# Altium schematic sheet Top_Level.SchDoc: Top Level
size A4; DocumentNumber: 1; SheetNumber: 1; SheetTotal: 18
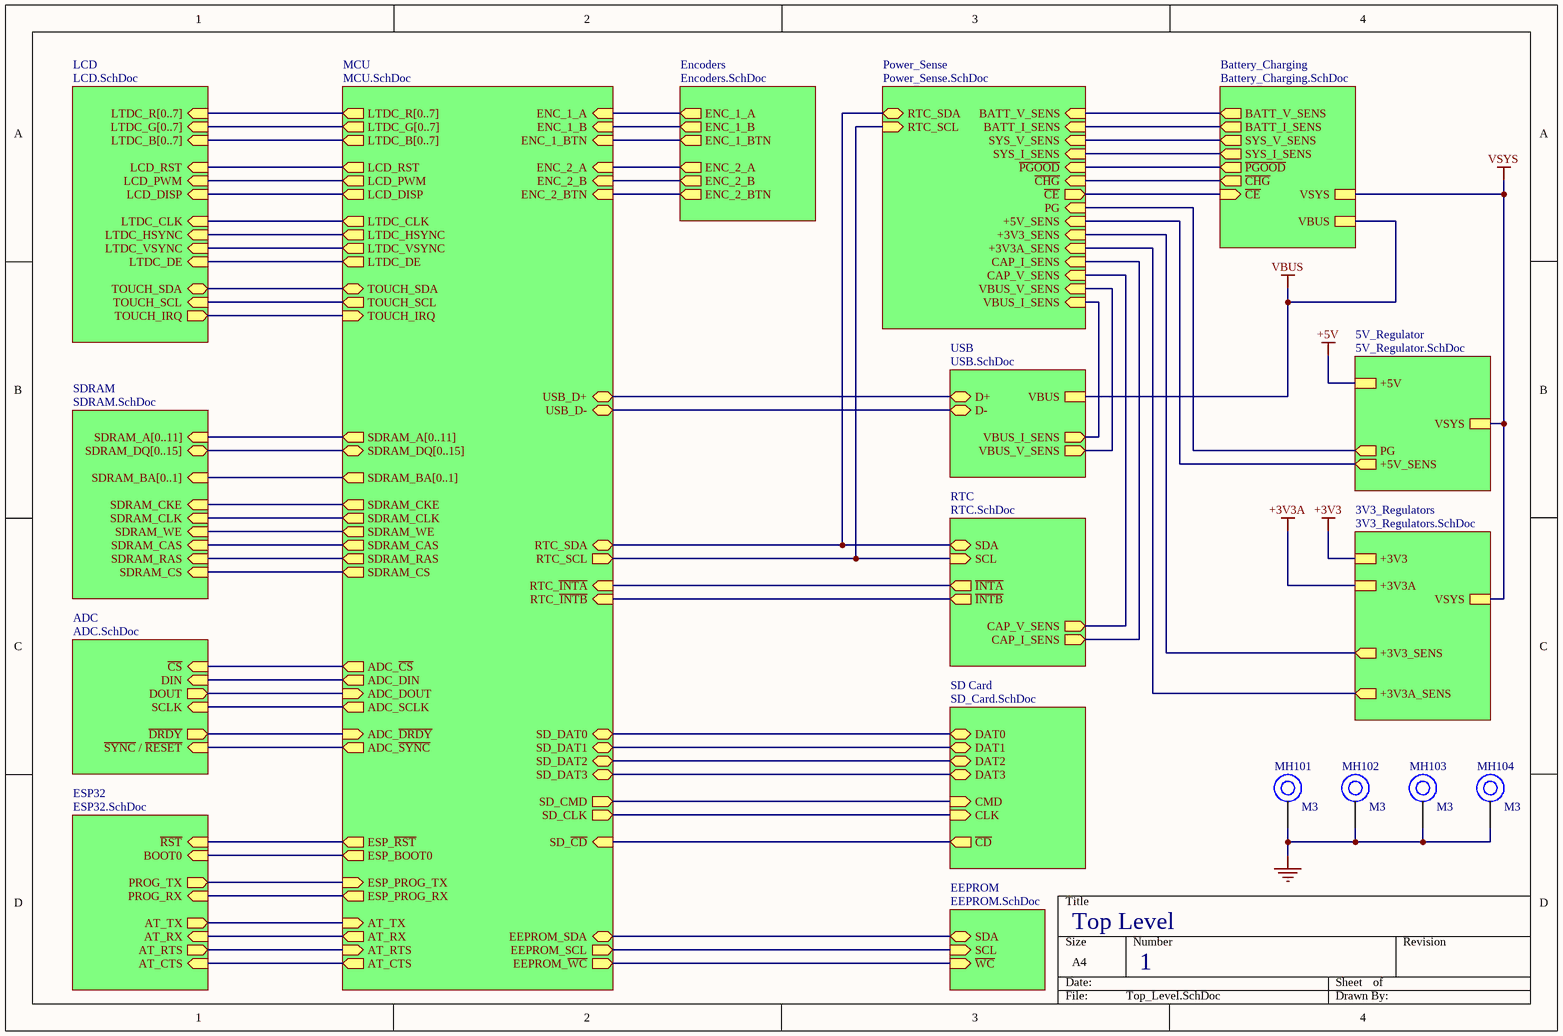
[diagram p0: Top_Level.SchDoc]

## Parts
MH101  M3  [M3_Mounting_Hole]
MH102  M3  [M3_Mounting_Hole]
MH103  M3  [M3_Mounting_Hole]
MH104  M3  [M3_Mounting_Hole]

## Sub-sheets
3V3_Regulators = 3V3_Regulators.SchDoc: +3V3, VSYS, +3V3_SENS (out), +3V3A, +3V3A_SENS (out)
5V_Regulator = 5V_Regulator.SchDoc: +5V, VSYS, PG (out), +5V_SENS (out)
ADC = ADC.SchDoc: ~{CS} (in), DIN (in), DOUT (out), SCLK (in), ~{DRDY} (out), ~{SYNC} / ~{RESET} (in)
Battery_Charging = Battery_Charging.SchDoc: VBUS, BATT_V_SENS (out), BATT_I_SENS (out), SYS_V_SENS (out), SYS_I_SENS (out), ~{PGOOD} (out), ~{CHG} (out), ~{CE} (in), VSYS
EEPROM = EEPROM.SchDoc: SDA (bidir), SCL (in), ~{WC} (in)
Encoders = Encoders.SchDoc: ENC_1_A (out), ENC_1_B (out), ENC_1_BTN (out), ENC_2_BTN (out), ENC_2_B (out), ENC_2_A (out)
ESP32 = ESP32.SchDoc: ~{RST} (in), BOOT0 (in), PROG_RX (in), PROG_TX (out), AT_TX (out), AT_RX (in), AT_RTS (out), AT_CTS (in)
LCD = LCD.SchDoc: LTDC_B[0..7] (in), LTDC_G[0..7] (in), LTDC_R[0..7] (in), LCD_RST (in), LCD_PWM (in), TOUCH_SDA (bidir), TOUCH_SCL (in), TOUCH_IRQ (out), LTDC_DE (in), LTDC_VSYNC (in), LTDC_HSYNC (in), LTDC_CLK (in), LCD_DISP (in)
MCU = MCU.SchDoc: LTDC_B[0..7] (out), LTDC_G[0..7] (out), LTDC_R[0..7] (out), EEPROM_SDA (bidir), EEPROM_SCL (out), EEPROM_~{WC} (out), AT_CTS (out), AT_RTS (in), AT_RX (out), AT_TX (in), ESP_PROG_RX (out), ESP_PROG_TX (in), ESP_BOOT0 (out), ESP_~{RST} (out), ADC_~{SYNC} (out), ADC_~{DRDY} (in), ADC_SCLK (out), ADC_DOUT (in), ADC_DIN (out), ADC_~{CS} (out), SDRAM_CS (out), SDRAM_RAS (out), SDRAM_CAS (out), SDRAM_WE (out), SDRAM_CLK (out), SDRAM_CKE (out), SDRAM_BA[0..1] (out), SDRAM_DQ[0..15] (bidir), SDRAM_A[0..11] (out), LCD_RST (out), LCD_PWM (out), TOUCH_IRQ (in), TOUCH_SCL (out), TOUCH_SDA (bidir), LTDC_CLK (out), LCD_DISP (out), LTDC_HSYNC (out), LTDC_VSYNC (out), LTDC_DE (out), SD_~{CD} (in), SD_CLK (out), SD_CMD (out), SD_DAT3 (bidir), SD_DAT2 (bidir), SD_DAT1 (bidir), SD_DAT0 (bidir), RTC_~{INTB} (in), RTC_~{INTA} (in), RTC_SCL (out), RTC_SDA (bidir), USB_D- (bidir), USB_D+ (bidir), ENC_1_A (in), ENC_1_B (in), ENC_1_BTN (in), ENC_2_A (in), ENC_2_B (in), ENC_2_BTN (in)
Power_Sense = Power_Sense.SchDoc: BATT_V_SENS (in), BATT_I_SENS (in), SYS_V_SENS (in), SYS_I_SENS (in), ~{PGOOD} (in), ~{CHG} (in), ~{CE} (out), PG (in), +5V_SENS (in), +3V3_SENS (in), +3V3A_SENS (in), CAP_I_SENS (in), CAP_V_SENS (in), VBUS_V_SENS (in), VBUS_I_SENS (in), RTC_SDA (bidir), RTC_SCL (in)
RTC = RTC.SchDoc: SDA (bidir), SCL (in), ~{INTA} (out), ~{INTB} (out), CAP_I_SENS (out), CAP_V_SENS (out)
SD Card = SD_Card.SchDoc: DAT0 (bidir), DAT1 (bidir), DAT3 (bidir), DAT2 (bidir), CMD (in), CLK (in), ~{CD} (out)
SDRAM = SDRAM.SchDoc: SDRAM_BA[0..1] (in), SDRAM_A[0..11] (in), SDRAM_CKE (in), SDRAM_CLK (in), SDRAM_WE (in), SDRAM_CAS (in), SDRAM_RAS (in), SDRAM_CS (in), SDRAM_DQ[0..15] (bidir)
USB = USB.SchDoc: D+ (bidir), D- (bidir), VBUS, VBUS_V_SENS (out), VBUS_I_SENS (out)

## Nets
+3V3: sheet 3V3_Regulators/+3V3
+3V3A: sheet 3V3_Regulators/+3V3A
+5V: sheet 5V_Regulator/+5V
GND: MH101.1 MH102.1 MH103.1 MH104.1
VBUS: sheet Battery_Charging/VBUS, sheet USB/VBUS
VSYS: sheet Battery_Charging/VSYS, sheet 5V_Regulator/VSYS, sheet 3V3_Regulators/VSYS
(unnamed): sheet MCU/EEPROM_SDA, sheet EEPROM/SDA
(unnamed): sheet MCU/EEPROM_SCL, sheet EEPROM/SCL
(unnamed): sheet MCU/EEPROM_~{WC}, sheet EEPROM/~{WC}
(unnamed): sheet MCU/AT_CTS, sheet ESP32/AT_CTS
(unnamed): sheet MCU/AT_RTS, sheet ESP32/AT_RTS
(unnamed): sheet MCU/AT_RX, sheet ESP32/AT_RX
(unnamed): sheet MCU/AT_TX, sheet ESP32/AT_TX
(unnamed): sheet MCU/ESP_PROG_RX, sheet ESP32/PROG_RX
(unnamed): sheet MCU/ESP_PROG_TX, sheet ESP32/PROG_TX
(unnamed): sheet MCU/ESP_BOOT0, sheet ESP32/BOOT0
(unnamed): sheet MCU/ESP_~{RST}, sheet ESP32/~{RST}
(unnamed): sheet MCU/ADC_~{SYNC}, sheet ADC/~{SYNC} / ~{RESET}
(unnamed): sheet MCU/ADC_~{DRDY}, sheet ADC/~{DRDY}
(unnamed): sheet MCU/ADC_SCLK, sheet ADC/SCLK
(unnamed): sheet MCU/ADC_DOUT, sheet ADC/DOUT
(unnamed): sheet MCU/ADC_DIN, sheet ADC/DIN
(unnamed): sheet MCU/ADC_~{CS}, sheet ADC/~{CS}
(unnamed): sheet MCU/SDRAM_CS, sheet SDRAM/SDRAM_CS
(unnamed): sheet MCU/SDRAM_RAS, sheet SDRAM/SDRAM_RAS
(unnamed): sheet MCU/SDRAM_CAS, sheet SDRAM/SDRAM_CAS
(unnamed): sheet MCU/SDRAM_WE, sheet SDRAM/SDRAM_WE
(unnamed): sheet MCU/SDRAM_CLK, sheet SDRAM/SDRAM_CLK
(unnamed): sheet MCU/SDRAM_CKE, sheet SDRAM/SDRAM_CKE
(unnamed): sheet MCU/LCD_RST, sheet LCD/LCD_RST
(unnamed): sheet MCU/LCD_PWM, sheet LCD/LCD_PWM
(unnamed): sheet MCU/TOUCH_IRQ, sheet LCD/TOUCH_IRQ
(unnamed): sheet MCU/TOUCH_SCL, sheet LCD/TOUCH_SCL
(unnamed): sheet MCU/TOUCH_SDA, sheet LCD/TOUCH_SDA
(unnamed): sheet MCU/LTDC_CLK, sheet LCD/LTDC_CLK
(unnamed): sheet MCU/LCD_DISP, sheet LCD/LCD_DISP
(unnamed): sheet MCU/LTDC_HSYNC, sheet LCD/LTDC_HSYNC
(unnamed): sheet MCU/LTDC_VSYNC, sheet LCD/LTDC_VSYNC
(unnamed): sheet MCU/LTDC_DE, sheet LCD/LTDC_DE
(unnamed): sheet MCU/SD_~{CD}, sheet SD Card/~{CD}
(unnamed): sheet MCU/SD_CLK, sheet SD Card/CLK
(unnamed): sheet MCU/SD_CMD, sheet SD Card/CMD
(unnamed): sheet MCU/SD_DAT3, sheet SD Card/DAT3
(unnamed): sheet MCU/SD_DAT2, sheet SD Card/DAT2
(unnamed): sheet MCU/SD_DAT1, sheet SD Card/DAT1
(unnamed): sheet MCU/SD_DAT0, sheet SD Card/DAT0
(unnamed): sheet MCU/RTC_~{INTB}, sheet RTC/~{INTB}
(unnamed): sheet MCU/RTC_~{INTA}, sheet RTC/~{INTA}
(unnamed): sheet MCU/RTC_SCL, sheet RTC/SCL, sheet Power_Sense/RTC_SCL
(unnamed): sheet MCU/RTC_SDA, sheet RTC/SDA, sheet Power_Sense/RTC_SDA
(unnamed): sheet MCU/USB_D-, sheet USB/D-
(unnamed): sheet MCU/USB_D+, sheet USB/D+
(unnamed): sheet MCU/ENC_1_A, sheet Encoders/ENC_1_A
(unnamed): sheet MCU/ENC_1_B, sheet Encoders/ENC_1_B
(unnamed): sheet MCU/ENC_1_BTN, sheet Encoders/ENC_1_BTN
(unnamed): sheet MCU/ENC_2_A, sheet Encoders/ENC_2_A
(unnamed): sheet MCU/ENC_2_B, sheet Encoders/ENC_2_B
(unnamed): sheet MCU/ENC_2_BTN, sheet Encoders/ENC_2_BTN
(unnamed): sheet Battery_Charging/BATT_V_SENS, sheet Power_Sense/BATT_V_SENS
(unnamed): sheet Battery_Charging/BATT_I_SENS, sheet Power_Sense/BATT_I_SENS
(unnamed): sheet Battery_Charging/SYS_V_SENS, sheet Power_Sense/SYS_V_SENS
(unnamed): sheet Battery_Charging/SYS_I_SENS, sheet Power_Sense/SYS_I_SENS
(unnamed): sheet Battery_Charging/~{PGOOD}, sheet Power_Sense/~{PGOOD}
(unnamed): sheet Battery_Charging/~{CHG}, sheet Power_Sense/~{CHG}
(unnamed): sheet Battery_Charging/~{CE}, sheet Power_Sense/~{CE}
(unnamed): sheet USB/VBUS_V_SENS, sheet Power_Sense/VBUS_V_SENS
(unnamed): sheet USB/VBUS_I_SENS, sheet Power_Sense/VBUS_I_SENS
(unnamed): sheet RTC/CAP_I_SENS, sheet Power_Sense/CAP_I_SENS
(unnamed): sheet RTC/CAP_V_SENS, sheet Power_Sense/CAP_V_SENS
(unnamed): sheet 5V_Regulator/PG, sheet Power_Sense/PG
(unnamed): sheet 5V_Regulator/+5V_SENS, sheet Power_Sense/+5V_SENS
(unnamed): sheet 3V3_Regulators/+3V3_SENS, sheet Power_Sense/+3V3_SENS
(unnamed): sheet 3V3_Regulators/+3V3A_SENS, sheet Power_Sense/+3V3A_SENS

## Buses and harness runs
bus sheet LCD/LTDC_B[0..7] = sheet MCU/LTDC_B[0..7]
bus sheet LCD/LTDC_G[0..7] = sheet MCU/LTDC_G[0..7]
bus sheet LCD/LTDC_R[0..7] = sheet MCU/LTDC_R[0..7]
bus sheet MCU/SDRAM_A[0..11] = sheet SDRAM/SDRAM_A[0..11]
bus sheet MCU/SDRAM_BA[0..1] = sheet SDRAM/SDRAM_BA[0..1]
bus sheet MCU/SDRAM_DQ[0..15] = sheet SDRAM/SDRAM_DQ[0..15]

## Library data of the parts
MH101-MH104 = M3_Mounting_Hole